# Altium project P2_OBC-ADCS CubeSat - Copy.PrjPcb (part 1 of 2)
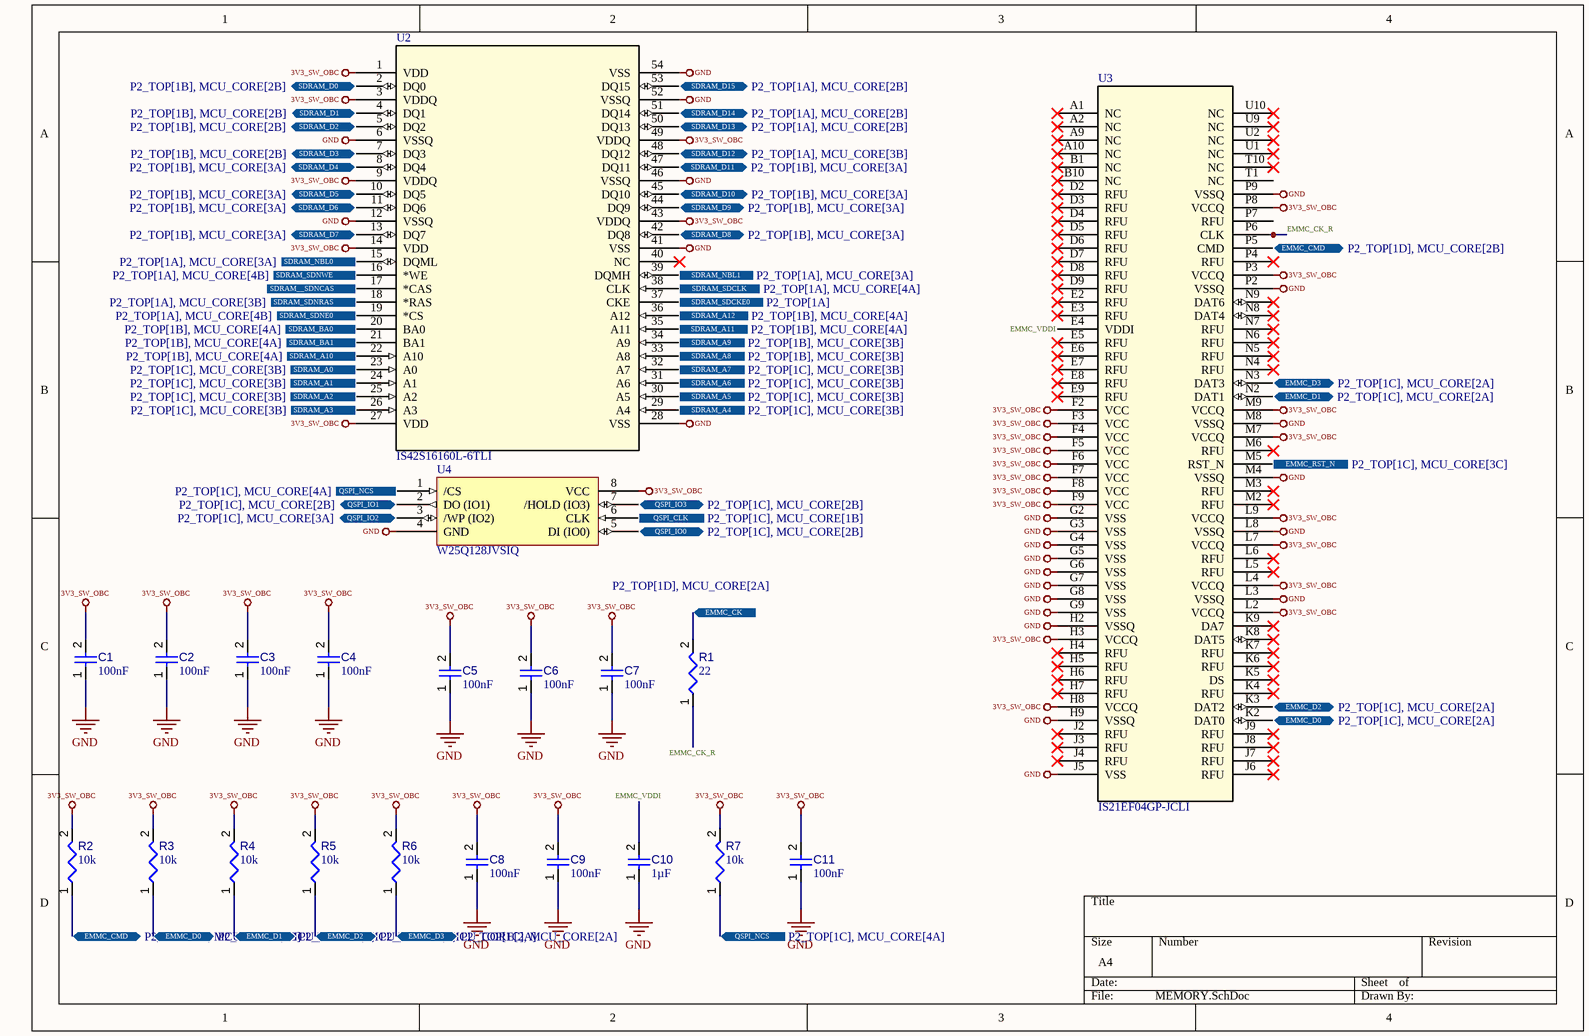
[diagram p0:  MEMORY.SchDoc]
9 sheets, 106 parts. Net scope: hierarchical (ports join the sheet entries above them; power ports are global).
Sheets:
   MEMORY.SchDoc
   P2_TOP.SchDoc
   PWR_IN.SchDoc
   MCU_CORE.SchDoc
   CAM_IF.SchDoc
   ADCS_SENS.SchDoc
   BUS_IF.SchDoc
   MTQ_CH.SchDoc
   PANEL_CH.SchDoc

## Sheet  MEMORY.SchDoc
size A4; SheetNumber: 2; SheetTotal: 9

### Parts
C1  value 100nF  [CAPC0402(1005)60_L]  (hidden comment: Capacitor 100nF +/-20% 25V 0402)
C2  value 100nF  [CAPC0402(1005)60_L]  (hidden comment: Capacitor 100nF +/-20% 25V 0402)
C3  value 100nF  [CAPC0402(1005)60_L]  (hidden comment: Capacitor 100nF +/-20% 25V 0402)
C4  value 100nF  [CAPC0402(1005)60_L]  (hidden comment: Capacitor 100nF +/-20% 25V 0402)
C5  value 100nF  [CAPC0402(1005)60_L]  (hidden comment: Capacitor 100nF +/-20% 25V 0402)
C6  value 100nF  [CAPC0402(1005)60_L]  (hidden comment: Capacitor 100nF +/-20% 25V 0402)
C7  value 100nF  [CAPC0402(1005)60_L]  (hidden comment: Capacitor 100nF +/-20% 25V 0402)
C8  value 100nF  [CAPC0402(1005)60_L]  (hidden comment: Capacitor 100nF +/-20% 25V 0402)
C9  value 100nF  [CAPC0402(1005)60_L]  (hidden comment: Capacitor 100nF +/-20% 25V 0402)
C10  value 1µF  [CAPC0603(1608)100_L]  (hidden comment: Capacitor 1µF +/-40% 50V 0603)
C11  value 100nF  [CAPC0402(1005)60_L]  (hidden comment: Capacitor 100nF +/-20% 25V 0402)
R1  value 22  [RESC0402(1005)_L]  (hidden comment: Resistor 22R  +/-5 % 0402 63 mW)
R2  value 10k  [RESC1005X40X25ML05T05]  (hidden comment: Resistor 10k +/-1% 0402 100 mW)
R3  value 10k  [RESC1005X40X25ML05T05]  (hidden comment: Resistor 10k +/-1% 0402 100 mW)
R4  value 10k  [RESC1005X40X25ML05T05]  (hidden comment: Resistor 10k +/-1% 0402 100 mW)
R5  value 10k  [RESC1005X40X25ML05T05]  (hidden comment: Resistor 10k +/-1% 0402 100 mW)
R6  value 10k  [RESC1005X40X25ML05T05]  (hidden comment: Resistor 10k +/-1% 0402 100 mW)
R7  value 10k  [RESC1005X40X25ML05T05]  (hidden comment: Resistor 10k +/-1% 0402 100 mW)
U2  IS42S16160L-6TLI  [IS42S16160L-6TLI-Footprint-1]
U3  IS21EF04GP-JCLI  [IS21EF04GP-JCLI-Footprint-1]
U4  W25Q128JVSIQ  [W25Q128JVSIQ-Footprint-1]

### Ports
EMMC_CK (in, see P2_TOP[1D], MCU_CORE[2A]), EMMC_CMD (bidir, see P2_TOP[1D], MCU_CORE[2B]), EMMC_D0 (bidir, see P2_TOP[1C], MCU_CORE[2A]), EMMC_D1 (bidir, see P2_TOP[1C], MCU_CORE[2A]), EMMC_D2 (bidir, see P2_TOP[1C], MCU_CORE[2A]), EMMC_D3 (bidir, see P2_TOP[1C], MCU_CORE[2A]), EMMC_RST_N (in, see P2_TOP[1C], MCU_CORE[3C]), QSPI_CLK (in, see P2_TOP[1C], MCU_CORE[1B]), QSPI_IO0 (bidir, see P2_TOP[1C], MCU_CORE[2B]), QSPI_IO1 (bidir, see P2_TOP[1C], MCU_CORE[2B]), QSPI_IO2 (bidir, see P2_TOP[1C], MCU_CORE[3A]), QSPI_IO3 (bidir, see P2_TOP[1C], MCU_CORE[2B]), QSPI_NCS (in, see P2_TOP[1C], MCU_CORE[4A]), SDRAM__SDNCAS (in), SDRAM_A0 (in, see P2_TOP[1C], MCU_CORE[3B]), SDRAM_A1 (in, see P2_TOP[1C], MCU_CORE[3B]), SDRAM_A2 (in, see P2_TOP[1C], MCU_CORE[3B]), SDRAM_A3 (in, see P2_TOP[1C], MCU_CORE[3B]), SDRAM_A4 (in, see P2_TOP[1C], MCU_CORE[3B]), SDRAM_A5 (in, see P2_TOP[1C], MCU_CORE[3B]), SDRAM_A6 (in, see P2_TOP[1C], MCU_CORE[3B]), SDRAM_A7 (in, see P2_TOP[1C], MCU_CORE[3B]), SDRAM_A8 (in, see P2_TOP[1B], MCU_CORE[3B]), SDRAM_A9 (in, see P2_TOP[1B], MCU_CORE[3B]), SDRAM_A10 (in, see P2_TOP[1B], MCU_CORE[4A]), SDRAM_A11 (in, see P2_TOP[1B], MCU_CORE[4A]), SDRAM_A12 (in, see P2_TOP[1B], MCU_CORE[4A]), SDRAM_BA0 (in, see P2_TOP[1B], MCU_CORE[4A]), SDRAM_BA1 (in, see P2_TOP[1B], MCU_CORE[4A]), SDRAM_D0 (bidir, see P2_TOP[1B], MCU_CORE[2B]), SDRAM_D1 (bidir, see P2_TOP[1B], MCU_CORE[2B]), SDRAM_D2 (bidir, see P2_TOP[1B], MCU_CORE[2B]), SDRAM_D3 (bidir, see P2_TOP[1B], MCU_CORE[2B]), SDRAM_D4 (bidir, see P2_TOP[1B], MCU_CORE[3A]), SDRAM_D5 (bidir, see P2_TOP[1B], MCU_CORE[3A]), SDRAM_D6 (bidir, see P2_TOP[1B], MCU_CORE[3A]), SDRAM_D7 (bidir, see P2_TOP[1B], MCU_CORE[3A]), SDRAM_D8 (bidir, see P2_TOP[1B], MCU_CORE[3A]), SDRAM_D9 (bidir, see P2_TOP[1B], MCU_CORE[3A]), SDRAM_D10 (bidir, see P2_TOP[1B], MCU_CORE[3A]), SDRAM_D11 (bidir, see P2_TOP[1B], MCU_CORE[3A]), SDRAM_D12 (bidir, see P2_TOP[1A], MCU_CORE[3B]), SDRAM_D13 (bidir, see P2_TOP[1A], MCU_CORE[2B]), SDRAM_D14 (bidir, see P2_TOP[1A], MCU_CORE[2B]), SDRAM_D15 (bidir, see P2_TOP[1A], MCU_CORE[2B]), SDRAM_NBL0 (in, see P2_TOP[1A], MCU_CORE[3A]), SDRAM_NBL1 (in, see P2_TOP[1A], MCU_CORE[3A]), SDRAM_SDCKE0 (in, see P2_TOP[1A]), SDRAM_SDCLK (in, see P2_TOP[1A], MCU_CORE[4A]), SDRAM_SDNE0 (in, see P2_TOP[1A], MCU_CORE[4B]), SDRAM_SDNRAS (in, see P2_TOP[1A], MCU_CORE[3B]), SDRAM_SDNWE (in, see P2_TOP[1A], MCU_CORE[4B])

### Nets
3V3_SW_OBC: C1.2 C2.2 C3.2 C4.2 C5.2 C6.2 C7.2 C8.2 C9.2 C11.2 R2.2 R3.2 R4.2 R5.2 R6.2 R7.2 U2.1(VDD) U2.3(VDDQ) U2.9(VDDQ) U2.14(VDD) U2.27(VDD) U2.43(VDDQ) U2.49(VDDQ) U3.F2(VCC) U3.F3(VCC) U3.F4(VCC) U3.F5(VCC) U3.F6(VCC) U3.F7(VCC) U3.F8(VCC) U3.F9(VCC) U3.H3(VCCQ) U3.H8(VCCQ) U3.L2(VCCQ) U3.L4(VCCQ) U3.L7(VCCQ) U3.L9(VCCQ) U3.M7(VCCQ) U3.M9(VCCQ) U3.P3(VCCQ) U3.P8(VCCQ) U4.8(VCC)
GND: C1.1 C2.1 C3.1 C4.1 C5.1 C6.1 C7.1 C8.1 C9.1 C10.1 C11.1 U2.6(VSSQ) U2.12(VSSQ) U2.28(VSS) U2.41(VSS) U2.46(VSSQ) U2.52(VSSQ) U2.54(VSS) U3.G2(VSS) U3.G3(VSS) U3.G4(VSS) U3.G5(VSS) U3.G6(VSS) U3.G7(VSS) U3.G8(VSS) U3.G9(VSS) U3.H2(VSSQ) U3.H9(VSSQ) U3.J5(VSS) U3.L3(VSSQ) U3.L8(VSSQ) U3.M4(VSSQ) U3.M8(VSSQ) U3.P2(VSSQ) U3.P9(VSSQ) U4.4(GND)
EMMC_CK_R: R1.1 U3.P6(CLK)
EMMC_VDDI: C10.2 U3.E4(VDDI)
NetR1_2: R1.2 ; port EMMC_CK
NetR2_1: R2.1 U3.P5(CMD) ; port EMMC_CMD
NetR3_1: R3.1 U3.K2(DAT0) ; port EMMC_D0
NetR4_1: R4.1 U3.N2(DAT1) ; port EMMC_D1
NetR5_1: R5.1 U3.K3(DAT2) ; port EMMC_D2
NetR6_1: R6.1 U3.N3(DAT3) ; port EMMC_D3
NetR7_1: R7.1 U4.1(/CS) ; port QSPI_NCS
NetU2_2: U2.2(DQ0) ; port SDRAM_D0
NetU2_4: U2.4(DQ1) ; port SDRAM_D1
NetU2_5: U2.5(DQ2) ; port SDRAM_D2
NetU2_7: U2.7(DQ3) ; port SDRAM_D3
NetU2_8: U2.8(DQ4) ; port SDRAM_D4
NetU2_10: U2.10(DQ5) ; port SDRAM_D5
NetU2_11: U2.11(DQ6) ; port SDRAM_D6
NetU2_13: U2.13(DQ7) ; port SDRAM_D7
NetU2_15: U2.15(DQML) ; port SDRAM_NBL0
NetU2_16: U2.16(*WE) ; port SDRAM_SDNWE
NetU2_17: U2.17(*CAS) ; port SDRAM__SDNCAS
NetU2_18: U2.18(*RAS) ; port SDRAM_SDNRAS
NetU2_19: U2.19(*CS) ; port SDRAM_SDNE0
NetU2_20: U2.20(BA0) ; port SDRAM_BA0
NetU2_21: U2.21(BA1) ; port SDRAM_BA1
NetU2_22: U2.22(A10) ; port SDRAM_A10
NetU2_23: U2.23(A0) ; port SDRAM_A0
NetU2_24: U2.24(A1) ; port SDRAM_A1
NetU2_25: U2.25(A2) ; port SDRAM_A2
NetU2_26: U2.26(A3) ; port SDRAM_A3
NetU2_29: U2.29(A4) ; port SDRAM_A4
NetU2_30: U2.30(A5) ; port SDRAM_A5
NetU2_31: U2.31(A6) ; port SDRAM_A6
NetU2_32: U2.32(A7) ; port SDRAM_A7
NetU2_33: U2.33(A8) ; port SDRAM_A8
NetU2_34: U2.34(A9) ; port SDRAM_A9
NetU2_35: U2.35(A11) ; port SDRAM_A11
NetU2_36: U2.36(A12) ; port SDRAM_A12
NetU2_37: U2.37(CKE) ; port SDRAM_SDCKE0
NetU2_38: U2.38(CLK) ; port SDRAM_SDCLK
NetU2_39: U2.39(DQMH) ; port SDRAM_NBL1
NetU2_42: U2.42(DQ8) ; port SDRAM_D8
NetU2_44: U2.44(DQ9) ; port SDRAM_D9
NetU2_45: U2.45(DQ10) ; port SDRAM_D10
NetU2_47: U2.47(DQ11) ; port SDRAM_D11
NetU2_48: U2.48(DQ12) ; port SDRAM_D12
NetU2_50: U2.50(DQ13) ; port SDRAM_D13
NetU2_51: U2.51(DQ14) ; port SDRAM_D14
NetU2_53: U2.53(DQ15) ; port SDRAM_D15
NetU3_M5: U3.M5(RST_N) ; port EMMC_RST_N
NetU4_2: U4.2(DO_(IO1)) ; port QSPI_IO1
NetU4_3: U4.3(/WP_(IO2)) ; port QSPI_IO2
NetU4_5: U4.5(DI_(IO0)) ; port QSPI_IO0
NetU4_6: U4.6(CLK) ; port QSPI_CLK
NetU4_7: U4.7(/HOLD_(IO3)) ; port QSPI_IO3

Not connected (* = marked no-connect by the designer): U2 40(NC)*; U3 A1(NC)* A2(NC)* A9(NC)* A10(NC)* B1(NC)* B10(NC)* D2(RFU)* D3(RFU)* D4(RFU)* D5(RFU)* D6(RFU)* D7(RFU)* D8(RFU)* D9(RFU)* E2(RFU)* E3(RFU)* E5(RFU)* E6(RFU)* E7(RFU)* E8(RFU)* E9(RFU)* H4(RFU)* H5(RFU)* H6(RFU)* H7(RFU)* J2(RFU)* J3(RFU)* J4(RFU)* J6(RFU)* J7(RFU)* J8(RFU)* J9(RFU)* K4(RFU)* K5(DS)* K6(RFU)* K7(RFU)* K8(DAT5)* K9(DA7)* L5(RFU)* L6(RFU)* M2(RFU)* M3(RFU)* M6(RFU)* N4(RFU)* N5(RFU)* N6(RFU)* N7(RFU)* N8(DAT4)* N9(DAT6)* P4(RFU)* P7(RFU) T1(NC) T10(NC)* U1(NC)* U2(NC)* U9(NC)* U10(NC)*

### Library data of the parts
C1-C9 C11 = CMP-001-00065-4: Chip Capacitor, 100nF +/-20%, 25V, 0402, Thickness 0.6 mm; Tolerance: 10%; Max Operating Temperature: 85°C; Min Operating Temperature: -55°C; Pins: 2; Voltage Rating: 25V; Mounting Technology: SMT; Case/Package: 0402
C10 = CMP-001-00078-4: Chip Capacitor, 1µF +/-40%, 50V, 0603, Thickness 1 mm; Tolerance: 10%; Case/Package: 0603; Pins: 2; Max Operating Temperature: 85°C; Voltage Rating: 50V; Mounting Technology: SMT; Min Operating Temperature: -55°C
R1 = CMP-009-00164-3: Chip Resistor, 22 Ohms, +/-5 %, 63 mW, -55 to 155 degC, 0402; Tolerance: 5%; Power: 63mW; Pins: 2; Min Operating Temperature: -55°C; Max Operating Temperature: 155°C; Case/Package: 0402
R2-R7 = CMP-009-00015-5: Chip Resistor, 10 KOhm, +/- 1%, 0.1 W, -55 to 155 degC, 0402 (1005 Metric); Voltage Rating: 50V; Power: 100mW; Case/Package: 0402; RoHS Compliant: True; Min Operating Temperature: -55°C; Mounting Technology: SM; Tolerance: 1%; Max Operating Temperature: 155°C; Pins: 2
U2 = CMP-020-00025-3: 256M, 3.3V, Sdram, 16Mx16, 166Mhz, 54 Pi;; Number of Circuits: 1; Access Time: 5.4ns; Min Supply Voltage: 3V; Max Supply Current: 160mA; Max Supply Voltage: 3.6V; Terminal Pitch: 800µm; REACH SVHC: Unaffected; Length: 22.22mm; Harmonized Tariff Schedule (HTS) Code: 8542.32.00.24; Introduction Date: 2022-01-25; Min Operating Temperature: -40°C; Lifecycle Status: Production; Max Operating Temperature: 85°C; RoHS: Compliant; Number of Ports: 1; Width: 10.16mm; Export Control Classification Number (ECCN) Code: EAR99; Height - Seated (Max): 1.2mm; Number of Terminals: 54; Nominal Supply Voltage (DC): 3.3V; Country of Origin: Mainland China, Taiwan
U3 = CMP-019-00054-3: Flash Memory, pSLC NAND, 4 Gbyte, 32G x 1bit, 8G x 4bit, 4G x 8bit, eMMC 5.1, 153 Pins, FBGA; Number of Circuits: 1; Max Supply Voltage: 3.6V; Min Supply Voltage: 2.7V; Max Supply Current: 45mA; Nominal Supply Voltage (DC): 3.3V; Lifecycle Status: Production; Length: 13mm; REACH SVHC: Unaffected; Width: 11.5mm; Height - Seated (Max): 1mm; Min Operating Temperature: -40°C; RoHS: Compliant; Terminal Pitch: 500µm; Max Operating Temperature: 85°C; Number of Terminals: 153
U4 = CMP-019-00055-2: NOR Flash Serial (SPI, Dual SPI, Quad SPI) 3.3V 128M-bit 16M x 8 6ns 8-Pin SOIC Tube; Min Supply Voltage: 2.7V; Nominal Supply Voltage (DC): 3V; Max Supply Voltage: 3.6V; Frequency: 104MHz; Max Supply Current: 20mA; Number of Circuits: 1; Memory Size: 16MB; Temperature Grade: Industrial; Number of Terminals: 8; Length: 5.23mm; Introduction Date: 2016-11-14; Height - Seated (Max): 2.16mm; China RoHS: Compliant; Min Operating Temperature: -40°C; Lifecycle Status: Production; Max Operating Temperature: 85°C; REACH SVHC: Unaffected; Height: 2.16mm; Country of Origin: Taiwan; Terminal Pitch: 1.27mm; RoHS: Compliant; Interface: SPI; Case/Package: SOP; Width: 5.23mm; Memory Format: FLASH; Export Control Classification Number (ECCN) Code: EAR99; Ambient Temperature Range High: 85°C; Harmonized Tariff Schedule (HTS) Code: 8542.32.00.51; Schedule B: 8542320070, 8542320070

## Sheet  P2_TOP.SchDoc
size A4; SheetNumber: 1; SheetTotal: 9
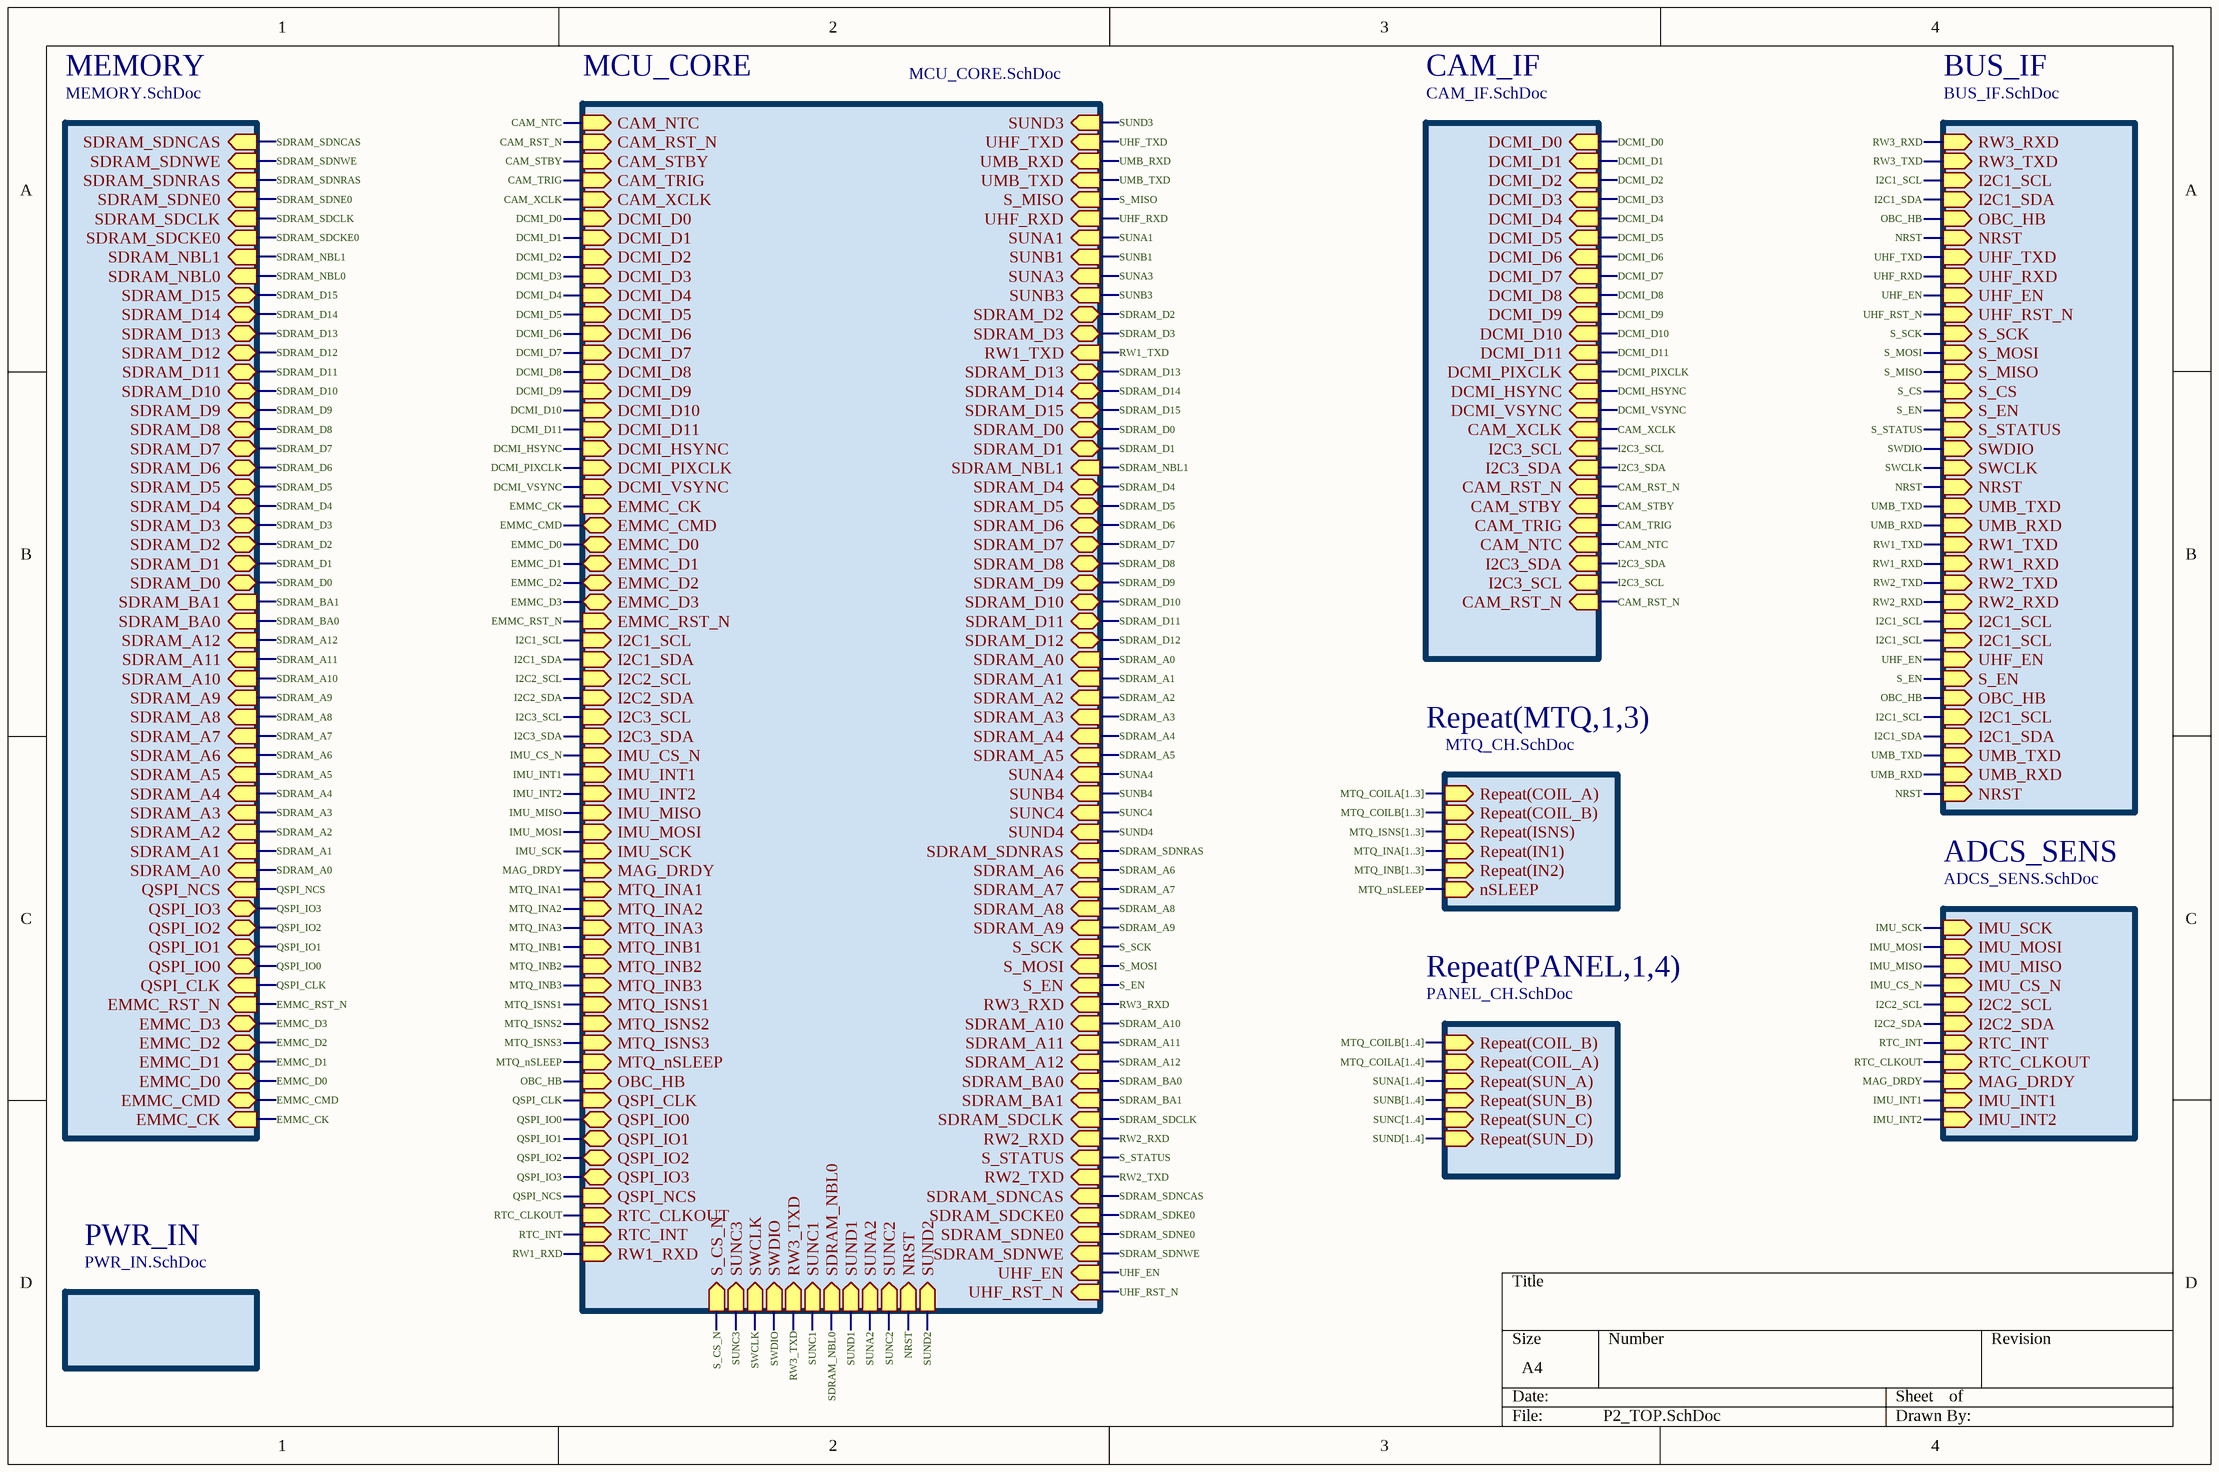
[diagram p1:  P2_TOP.SchDoc]

### Sub-sheets
ADCS_SENS = ADCS_SENS.SchDoc (file not in this document): IMU_SCK (in), IMU_MOSI (in), IMU_MISO (in), IMU_CS_N (in), I2C2_SCL (in), I2C2_SDA (in), RTC_INT (in), RTC_CLKOUT (in), MAG_DRDY (in), IMU_INT1 (in), IMU_INT2 (in)
BUS_IF = BUS_IF.SchDoc (file not in this document): RW3_RXD (in), RW3_TXD (in), I2C1_SCL (in), I2C1_SDA (in), OBC_HB (in), NRST (in), UHF_TXD (in), UHF_RXD (in), UHF_EN (in), UHF_RST_N (in), S_SCK (in), S_MOSI (in), S_MISO (in), S_CS (in), S_EN (in), S_STATUS (in), SWDIO (in), SWCLK (in), NRST (in), UMB_TXD (in), UMB_RXD (in), RW1_TXD (in), RW1_RXD (in), RW2_TXD (in), RW2_RXD (in), I2C1_SCL (in), I2C1_SCL (in), UHF_EN (in), S_EN (in), OBC_HB (in), I2C1_SCL (in), I2C1_SDA (in), UMB_TXD (in), UMB_RXD (in), NRST (in)
CAM_IF = CAM_IF.SchDoc (file not in this document): DCMI_D0 (in), DCMI_D1 (in), DCMI_D2 (in), DCMI_D3 (in), DCMI_D4 (in), DCMI_D5 (in), DCMI_D6 (in), DCMI_D7 (in), DCMI_D8 (in), DCMI_D9 (in), DCMI_D10 (in), DCMI_D11 (in), DCMI_PIXCLK (in), DCMI_HSYNC (in), DCMI_VSYNC (in), CAM_XCLK (in), I2C3_SCL (in), I2C3_SDA (in), CAM_RST_N (in), CAM_STBY (in), CAM_TRIG (in), CAM_NTC (in), I2C3_SDA (in), I2C3_SCL (in), CAM_RST_N (in)
MCU_CORE = MCU_CORE.SchDoc (file not in this document): CAM_NTC (in), CAM_RST_N (in), CAM_STBY (in), CAM_TRIG (in), CAM_XCLK (in), DCMI_D0 (in), DCMI_D1 (in), DCMI_D2 (in), DCMI_D3 (in), DCMI_D4 (in), DCMI_D5 (in), DCMI_D6 (in), DCMI_D7 (in), DCMI_D8 (in), DCMI_D9 (in), DCMI_D10 (in), DCMI_D11 (in), DCMI_HSYNC (in), DCMI_PIXCLK (in), DCMI_VSYNC (in), EMMC_CK (in), EMMC_CMD (bidir), EMMC_D0 (bidir), EMMC_D1 (bidir), EMMC_D2 (bidir), EMMC_D3 (bidir), EMMC_RST_N (in), I2C1_SCL (in), I2C1_SDA (in), I2C2_SCL (in), I2C2_SDA (in), I2C3_SCL (in), I2C3_SDA (in), IMU_CS_N (in), IMU_INT1 (in), IMU_INT2 (in), IMU_MISO (in), IMU_MOSI (in), IMU_SCK (in), MAG_DRDY (in), MTQ_INA1 (in), MTQ_INA2 (in), MTQ_INA3 (in), MTQ_INB1 (in), MTQ_INB2 (in), MTQ_INB3 (in), MTQ_ISNS1 (in), MTQ_ISNS2 (in), MTQ_ISNS3 (in), MTQ_nSLEEP (in), SUND3 (in), UHF_TXD (in), UMB_RXD (in), UMB_TXD (in), S_MISO (in), UHF_RXD (in), SUNA1 (in), SUNB1 (in), SUNA3 (in), SUNB3 (in), SDRAM_D2 (bidir), SDRAM_D3 (bidir), RW1_TXD (in), SDRAM_D13 (bidir), SDRAM_D14 (bidir), SDRAM_D15 (bidir), SDRAM_D0 (bidir), SDRAM_D1 (bidir), SDRAM_NBL1 (in), SDRAM_D4 (bidir), SDRAM_D5 (bidir), SDRAM_D6 (bidir), SDRAM_D7 (bidir), SDRAM_D8 (bidir), SDRAM_D9 (bidir), SDRAM_D10 (bidir), SDRAM_D11 (bidir), SDRAM_D12 (bidir), SDRAM_A0 (in), SDRAM_A1 (in), SDRAM_A2 (in), SDRAM_A3 (in), SDRAM_A4 (in), SDRAM_A5 (in), SUNA4 (in), SUNB4 (in), SUNC4 (in), SUND4 (in), SDRAM_SDNRAS (in), SDRAM_A6 (in), SDRAM_A7 (in), SDRAM_A8 (in), SDRAM_A9 (in), S_SCK (in), S_MOSI (in), S_EN (in), RW3_RXD (in), SDRAM_A10 (in), SDRAM_A11 (in), SDRAM_A12 (in), SDRAM_BA0 (in), SDRAM_BA1 (in), SDRAM_SDCLK (in), RW2_RXD (in), S_STATUS (in), RW2_TXD (in), SDRAM_SDNCAS (in), SDRAM_SDCKE0 (in), SDRAM_SDNE0 (in), SDRAM_SDNWE (in), UHF_EN (in), UHF_RST_N (in), OBC_HB (in), QSPI_CLK (in), QSPI_IO0 (bidir), QSPI_IO1 (bidir), QSPI_IO2 (bidir), QSPI_IO3 (bidir), QSPI_NCS (in), RTC_CLKOUT (in), RTC_INT (in), RW1_RXD (in), SUNC1 (in), SDRAM_NBL0 (in), SUND1 (in), SUNA2 (in), SUNC2 (in), NRST (in), SUND2 (in), RW3_TXD (in), SWDIO (in), SWCLK (in), SUNC3 (in), S_CS_N (in)
MEMORY = MEMORY.SchDoc (file not in this document): SDRAM_SDNWE (in), SDRAM_SDNRAS (in), SDRAM_SDNE0 (in), SDRAM_SDCLK (in), SDRAM_SDCKE0 (in), SDRAM_NBL1 (in), SDRAM_NBL0 (in), SDRAM_D15 (bidir), SDRAM_D14 (bidir), SDRAM_D13 (bidir), SDRAM_D12 (bidir), SDRAM_D11 (bidir), SDRAM_D10 (bidir), SDRAM_D9 (bidir), SDRAM_D8 (bidir), SDRAM_D7 (bidir), SDRAM_D6 (bidir), SDRAM_D5 (bidir), SDRAM_D4 (bidir), SDRAM_D3 (bidir), SDRAM_D2 (bidir), SDRAM_D1 (bidir), SDRAM_D0 (bidir), SDRAM_BA1 (in), SDRAM_BA0 (in), SDRAM_A12 (in), SDRAM_A11 (in), SDRAM_A10 (in), SDRAM_A9 (in), SDRAM_A8 (in), SDRAM_A7 (in), SDRAM_A6 (in), SDRAM_A5 (in), SDRAM_A4 (in), SDRAM_A3 (in), SDRAM_A2 (in), SDRAM_A1 (in), SDRAM_A0 (in), QSPI_NCS (in), QSPI_IO3 (bidir), QSPI_IO2 (bidir), QSPI_IO1 (bidir), QSPI_IO0 (bidir), QSPI_CLK (in), EMMC_RST_N (in), EMMC_D3 (bidir), EMMC_D2 (bidir), EMMC_D1 (bidir), EMMC_D0 (bidir), EMMC_CK (in), EMMC_CMD (bidir), SDRAM_SDNCAS (in)
PWR_IN = PWR_IN.SchDoc (file not in this document): no entries
Repeat(MTQ,1,3) = MTQ_CH.SchDoc (file not in this document): Repeat(COIL_A) (in), Repeat(COIL_B) (in), Repeat(ISNS) (in), Repeat(IN1) (in), Repeat(IN2) (in), nSLEEP (in)
Repeat(PANEL,1,4) = PANEL_CH.SchDoc (file not in this document): Repeat(COIL_B) (in), Repeat(COIL_A) (in), Repeat(SUN_A) (in), Repeat(SUN_B) (in), Repeat(SUN_C) (in), Repeat(SUN_D) (in)

### Nets
CAM_NTC: sheet CAM_IF/CAM_NTC, sheet MCU_CORE/CAM_NTC
CAM_RST_N: sheet CAM_IF/CAM_RST_N, sheet CAM_IF/CAM_RST_N, sheet MCU_CORE/CAM_RST_N
CAM_STBY: sheet CAM_IF/CAM_STBY, sheet MCU_CORE/CAM_STBY
CAM_TRIG: sheet CAM_IF/CAM_TRIG, sheet MCU_CORE/CAM_TRIG
CAM_XCLK: sheet CAM_IF/CAM_XCLK, sheet MCU_CORE/CAM_XCLK
DCMI_D0: sheet CAM_IF/DCMI_D0, sheet MCU_CORE/DCMI_D0
DCMI_D1: sheet CAM_IF/DCMI_D1, sheet MCU_CORE/DCMI_D1
DCMI_D2: sheet CAM_IF/DCMI_D2, sheet MCU_CORE/DCMI_D2
DCMI_D3: sheet CAM_IF/DCMI_D3, sheet MCU_CORE/DCMI_D3
DCMI_D4: sheet CAM_IF/DCMI_D4, sheet MCU_CORE/DCMI_D4
DCMI_D5: sheet CAM_IF/DCMI_D5, sheet MCU_CORE/DCMI_D5
DCMI_D6: sheet CAM_IF/DCMI_D6, sheet MCU_CORE/DCMI_D6
DCMI_D7: sheet CAM_IF/DCMI_D7, sheet MCU_CORE/DCMI_D7
DCMI_D8: sheet CAM_IF/DCMI_D8, sheet MCU_CORE/DCMI_D8
DCMI_D9: sheet CAM_IF/DCMI_D9, sheet MCU_CORE/DCMI_D9
DCMI_D10: sheet CAM_IF/DCMI_D10, sheet MCU_CORE/DCMI_D10
DCMI_D11: sheet CAM_IF/DCMI_D11, sheet MCU_CORE/DCMI_D11
DCMI_HSYNC: sheet CAM_IF/DCMI_HSYNC, sheet MCU_CORE/DCMI_HSYNC
DCMI_PIXCLK: sheet CAM_IF/DCMI_PIXCLK, sheet MCU_CORE/DCMI_PIXCLK
DCMI_VSYNC: sheet CAM_IF/DCMI_VSYNC, sheet MCU_CORE/DCMI_VSYNC
EMMC_CK: sheet MEMORY/EMMC_CK, sheet MCU_CORE/EMMC_CK
EMMC_CMD: sheet MEMORY/EMMC_CMD, sheet MCU_CORE/EMMC_CMD
EMMC_D0: sheet MEMORY/EMMC_D0, sheet MCU_CORE/EMMC_D0
EMMC_D1: sheet MEMORY/EMMC_D1, sheet MCU_CORE/EMMC_D1
EMMC_D2: sheet MEMORY/EMMC_D2, sheet MCU_CORE/EMMC_D2
EMMC_D3: sheet MEMORY/EMMC_D3, sheet MCU_CORE/EMMC_D3
EMMC_RST_N: sheet MEMORY/EMMC_RST_N, sheet MCU_CORE/EMMC_RST_N
I2C1_SCL: sheet MCU_CORE/I2C1_SCL, sheet BUS_IF/I2C1_SCL, sheet BUS_IF/I2C1_SCL, sheet BUS_IF/I2C1_SCL, sheet BUS_IF/I2C1_SCL
I2C1_SDA: sheet MCU_CORE/I2C1_SDA, sheet BUS_IF/I2C1_SDA, sheet BUS_IF/I2C1_SDA
I2C2_SCL: sheet MCU_CORE/I2C2_SCL, sheet ADCS_SENS/I2C2_SCL
I2C2_SDA: sheet MCU_CORE/I2C2_SDA, sheet ADCS_SENS/I2C2_SDA
I2C3_SCL: sheet CAM_IF/I2C3_SCL, sheet CAM_IF/I2C3_SCL, sheet MCU_CORE/I2C3_SCL
I2C3_SDA: sheet CAM_IF/I2C3_SDA, sheet CAM_IF/I2C3_SDA, sheet MCU_CORE/I2C3_SDA
IMU_CS_N: sheet MCU_CORE/IMU_CS_N, sheet ADCS_SENS/IMU_CS_N
IMU_INT1: sheet MCU_CORE/IMU_INT1, sheet ADCS_SENS/IMU_INT1
IMU_INT2: sheet MCU_CORE/IMU_INT2, sheet ADCS_SENS/IMU_INT2
IMU_MISO: sheet MCU_CORE/IMU_MISO, sheet ADCS_SENS/IMU_MISO
IMU_MOSI: sheet MCU_CORE/IMU_MOSI, sheet ADCS_SENS/IMU_MOSI
IMU_SCK: sheet MCU_CORE/IMU_SCK, sheet ADCS_SENS/IMU_SCK
MAG_DRDY: sheet MCU_CORE/MAG_DRDY, sheet ADCS_SENS/MAG_DRDY
MTQ_INA1: sheet MCU_CORE/MTQ_INA1
MTQ_INA2: sheet MCU_CORE/MTQ_INA2
MTQ_INA3: sheet MCU_CORE/MTQ_INA3
MTQ_INB1: sheet MCU_CORE/MTQ_INB1
MTQ_INB2: sheet MCU_CORE/MTQ_INB2
MTQ_INB3: sheet MCU_CORE/MTQ_INB3
MTQ_ISNS1: sheet MCU_CORE/MTQ_ISNS1
MTQ_ISNS2: sheet MCU_CORE/MTQ_ISNS2
MTQ_ISNS3: sheet MCU_CORE/MTQ_ISNS3
MTQ_nSLEEP: sheet MCU_CORE/MTQ_nSLEEP, sheet Repeat(MTQ,1,3)/nSLEEP
NRST: sheet MCU_CORE/NRST, sheet BUS_IF/NRST, sheet BUS_IF/NRST, sheet BUS_IF/NRST
OBC_HB: sheet MCU_CORE/OBC_HB, sheet BUS_IF/OBC_HB, sheet BUS_IF/OBC_HB
QSPI_CLK: sheet MEMORY/QSPI_CLK, sheet MCU_CORE/QSPI_CLK
QSPI_IO0: sheet MEMORY/QSPI_IO0, sheet MCU_CORE/QSPI_IO0
QSPI_IO1: sheet MEMORY/QSPI_IO1, sheet MCU_CORE/QSPI_IO1
QSPI_IO2: sheet MEMORY/QSPI_IO2, sheet MCU_CORE/QSPI_IO2
QSPI_IO3: sheet MEMORY/QSPI_IO3, sheet MCU_CORE/QSPI_IO3
QSPI_NCS: sheet MEMORY/QSPI_NCS, sheet MCU_CORE/QSPI_NCS
RTC_CLKOUT: sheet MCU_CORE/RTC_CLKOUT, sheet ADCS_SENS/RTC_CLKOUT
RTC_INT: sheet MCU_CORE/RTC_INT, sheet ADCS_SENS/RTC_INT
RW1_RXD: sheet MCU_CORE/RW1_RXD, sheet BUS_IF/RW1_RXD
RW1_TXD: sheet MCU_CORE/RW1_TXD, sheet BUS_IF/RW1_TXD
RW2_RXD: sheet MCU_CORE/RW2_RXD, sheet BUS_IF/RW2_RXD
RW2_TXD: sheet MCU_CORE/RW2_TXD, sheet BUS_IF/RW2_TXD
RW3_RXD: sheet MCU_CORE/RW3_RXD, sheet BUS_IF/RW3_RXD
RW3_TXD: sheet MCU_CORE/RW3_TXD, sheet BUS_IF/RW3_TXD
S_CS: sheet BUS_IF/S_CS
S_CS_N: sheet MCU_CORE/S_CS_N
S_EN: sheet MCU_CORE/S_EN, sheet BUS_IF/S_EN, sheet BUS_IF/S_EN
S_MISO: sheet MCU_CORE/S_MISO, sheet BUS_IF/S_MISO
S_MOSI: sheet MCU_CORE/S_MOSI, sheet BUS_IF/S_MOSI
S_SCK: sheet MCU_CORE/S_SCK, sheet BUS_IF/S_SCK
S_STATUS: sheet MCU_CORE/S_STATUS, sheet BUS_IF/S_STATUS
SDRAM_A0: sheet MEMORY/SDRAM_A0, sheet MCU_CORE/SDRAM_A0
SDRAM_A1: sheet MEMORY/SDRAM_A1, sheet MCU_CORE/SDRAM_A1
SDRAM_A2: sheet MEMORY/SDRAM_A2, sheet MCU_CORE/SDRAM_A2
SDRAM_A3: sheet MEMORY/SDRAM_A3, sheet MCU_CORE/SDRAM_A3
SDRAM_A4: sheet MEMORY/SDRAM_A4, sheet MCU_CORE/SDRAM_A4
SDRAM_A5: sheet MEMORY/SDRAM_A5, sheet MCU_CORE/SDRAM_A5
SDRAM_A6: sheet MEMORY/SDRAM_A6, sheet MCU_CORE/SDRAM_A6
SDRAM_A7: sheet MEMORY/SDRAM_A7, sheet MCU_CORE/SDRAM_A7
SDRAM_A8: sheet MEMORY/SDRAM_A8, sheet MCU_CORE/SDRAM_A8
SDRAM_A9: sheet MEMORY/SDRAM_A9, sheet MCU_CORE/SDRAM_A9
SDRAM_A10: sheet MEMORY/SDRAM_A10, sheet MCU_CORE/SDRAM_A10
SDRAM_A11: sheet MEMORY/SDRAM_A11, sheet MCU_CORE/SDRAM_A11
SDRAM_A12: sheet MEMORY/SDRAM_A12, sheet MCU_CORE/SDRAM_A12
SDRAM_BA0: sheet MEMORY/SDRAM_BA0, sheet MCU_CORE/SDRAM_BA0
SDRAM_BA1: sheet MEMORY/SDRAM_BA1, sheet MCU_CORE/SDRAM_BA1
SDRAM_D0: sheet MEMORY/SDRAM_D0, sheet MCU_CORE/SDRAM_D0
SDRAM_D1: sheet MEMORY/SDRAM_D1, sheet MCU_CORE/SDRAM_D1
SDRAM_D2: sheet MEMORY/SDRAM_D2, sheet MCU_CORE/SDRAM_D2
SDRAM_D3: sheet MEMORY/SDRAM_D3, sheet MCU_CORE/SDRAM_D3
SDRAM_D4: sheet MEMORY/SDRAM_D4, sheet MCU_CORE/SDRAM_D4
SDRAM_D5: sheet MEMORY/SDRAM_D5, sheet MCU_CORE/SDRAM_D5
SDRAM_D6: sheet MEMORY/SDRAM_D6, sheet MCU_CORE/SDRAM_D6
SDRAM_D7: sheet MEMORY/SDRAM_D7, sheet MCU_CORE/SDRAM_D7
SDRAM_D8: sheet MEMORY/SDRAM_D8, sheet MCU_CORE/SDRAM_D8
SDRAM_D9: sheet MEMORY/SDRAM_D9, sheet MCU_CORE/SDRAM_D9
SDRAM_D10: sheet MEMORY/SDRAM_D10, sheet MCU_CORE/SDRAM_D10
SDRAM_D11: sheet MEMORY/SDRAM_D11, sheet MCU_CORE/SDRAM_D11
SDRAM_D12: sheet MEMORY/SDRAM_D12, sheet MCU_CORE/SDRAM_D12
SDRAM_D13: sheet MEMORY/SDRAM_D13, sheet MCU_CORE/SDRAM_D13
SDRAM_D14: sheet MEMORY/SDRAM_D14, sheet MCU_CORE/SDRAM_D14
SDRAM_D15: sheet MEMORY/SDRAM_D15, sheet MCU_CORE/SDRAM_D15
SDRAM_NBL0: sheet MEMORY/SDRAM_NBL0, sheet MCU_CORE/SDRAM_NBL0
SDRAM_NBL1: sheet MEMORY/SDRAM_NBL1, sheet MCU_CORE/SDRAM_NBL1
SDRAM_SDCKE0: sheet MEMORY/SDRAM_SDCKE0
SDRAM_SDCLK: sheet MEMORY/SDRAM_SDCLK, sheet MCU_CORE/SDRAM_SDCLK
SDRAM_SDKE0: sheet MCU_CORE/SDRAM_SDCKE0
SDRAM_SDNCAS: sheet MEMORY/SDRAM_SDNCAS, sheet MCU_CORE/SDRAM_SDNCAS
SDRAM_SDNE0: sheet MEMORY/SDRAM_SDNE0, sheet MCU_CORE/SDRAM_SDNE0
SDRAM_SDNRAS: sheet MEMORY/SDRAM_SDNRAS, sheet MCU_CORE/SDRAM_SDNRAS
SDRAM_SDNWE: sheet MEMORY/SDRAM_SDNWE, sheet MCU_CORE/SDRAM_SDNWE
SUNA1: sheet MCU_CORE/SUNA1
SUNA2: sheet MCU_CORE/SUNA2
SUNA3: sheet MCU_CORE/SUNA3
SUNA4: sheet MCU_CORE/SUNA4
SUNB1: sheet MCU_CORE/SUNB1
SUNB3: sheet MCU_CORE/SUNB3
SUNB4: sheet MCU_CORE/SUNB4
SUNC1: sheet MCU_CORE/SUNC1
SUNC2: sheet MCU_CORE/SUNC2
SUNC3: sheet MCU_CORE/SUNC3
SUNC4: sheet MCU_CORE/SUNC4
SUND1: sheet MCU_CORE/SUND1
SUND2: sheet MCU_CORE/SUND2
SUND3: sheet MCU_CORE/SUND3
SUND4: sheet MCU_CORE/SUND4
SWCLK: sheet MCU_CORE/SWCLK, sheet BUS_IF/SWCLK
SWDIO: sheet MCU_CORE/SWDIO, sheet BUS_IF/SWDIO
UHF_EN: sheet MCU_CORE/UHF_EN, sheet BUS_IF/UHF_EN, sheet BUS_IF/UHF_EN
UHF_RST_N: sheet MCU_CORE/UHF_RST_N, sheet BUS_IF/UHF_RST_N
UHF_RXD: sheet MCU_CORE/UHF_RXD, sheet BUS_IF/UHF_RXD
UHF_TXD: sheet MCU_CORE/UHF_TXD, sheet BUS_IF/UHF_TXD
UMB_RXD: sheet MCU_CORE/UMB_RXD, sheet BUS_IF/UMB_RXD, sheet BUS_IF/UMB_RXD
UMB_TXD: sheet MCU_CORE/UMB_TXD, sheet BUS_IF/UMB_TXD, sheet BUS_IF/UMB_TXD

### Buses and harness runs
bus MTQ_COILA[1..3] = sheet Repeat(MTQ,1,3)/Repeat(COIL_A)
bus MTQ_COILA[1..4] = sheet Repeat(PANEL,1,4)/Repeat(COIL_A)
bus MTQ_COILB[1..3] = sheet Repeat(MTQ,1,3)/Repeat(COIL_B)
bus MTQ_COILB[1..4] = sheet Repeat(PANEL,1,4)/Repeat(COIL_B)
bus MTQ_INA[1..3] = sheet Repeat(MTQ,1,3)/Repeat(IN1)
bus MTQ_INB[1..3] = sheet Repeat(MTQ,1,3)/Repeat(IN2)
bus MTQ_ISNS[1..3] = sheet Repeat(MTQ,1,3)/Repeat(ISNS)
bus SUNA[1..4] = sheet Repeat(PANEL,1,4)/Repeat(SUN_A)
bus SUNB[1..4] = sheet Repeat(PANEL,1,4)/Repeat(SUN_B)
bus SUNC[1..4] = sheet Repeat(PANEL,1,4)/Repeat(SUN_C)
bus SUND[1..4] = sheet Repeat(PANEL,1,4)/Repeat(SUN_D)

## Sheet  PWR_IN.SchDoc
size A4; SheetNumber: 3; SheetTotal: 9
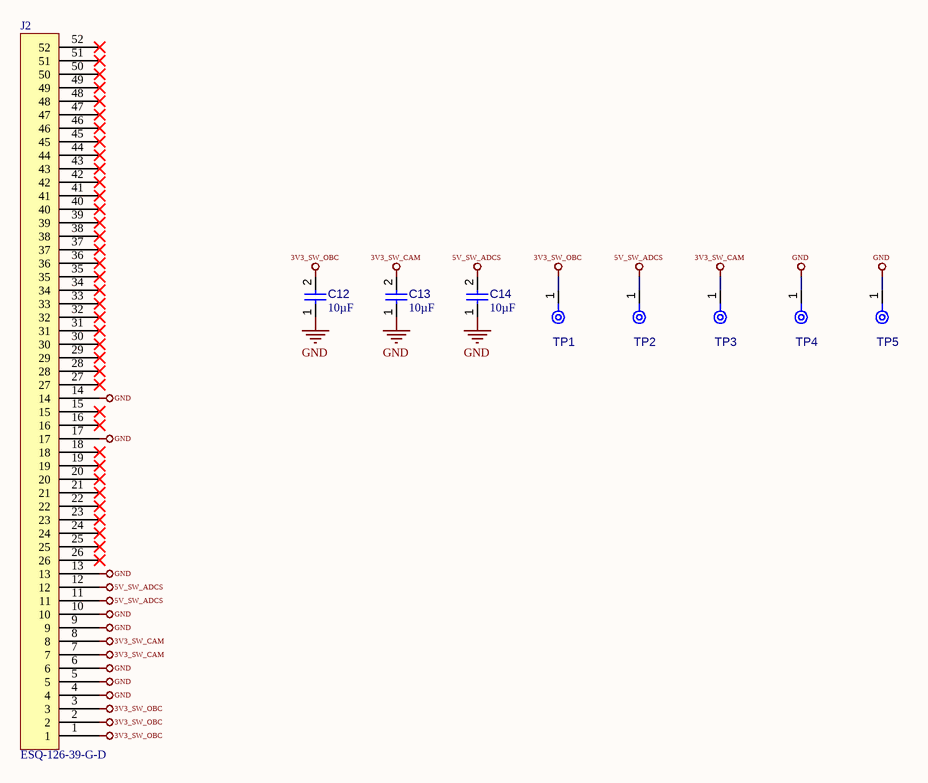
[diagram p2:  PWR_IN.SchDoc]

### Parts
C12  value 10µF  [CAPC0805(2012)145_L]  (hidden comment: Capacitor 10µF +/-20% 25V 0805)
C13  value 10µF  [CAPC0805(2012)145_L]  (hidden comment: Capacitor 10µF +/-20% 25V 0805)
C14  value 10µF  [CAPC0805(2012)145_L]  (hidden comment: Capacitor 10µF +/-20% 25V 0805)
J2  ESQ-126-39-G-D  [CONN_ESQ-126-39-G-D_SAI]
TP1  TPAD6R  [TP06R]  (value not drawn)  (no BOM)
TP2  TPAD6R  [TP06R]  (value not drawn)  (no BOM)
TP3  TPAD6R  [TP06R]  (value not drawn)  (no BOM)
TP4  TPAD6R  [TP06R]  (value not drawn)  (no BOM)
TP5  TPAD6R  [TP06R]  (value not drawn)  (no BOM)

### Nets
3V3_SW_CAM: C13.2 J2.7 J2.8 TP3.1(TP)
3V3_SW_OBC: C12.2 J2.1 J2.2 J2.3 TP1.1(TP)
5V_SW_ADCS: C14.2 J2.11 J2.12 TP2.1(TP)
GND: C12.1 C13.1 C14.1 J2.4 J2.5 J2.6 J2.9 J2.10 J2.13 J2.14 J2.17 TP4.1(TP) TP5.1(TP)

Not connected (* = marked no-connect by the designer): J2 15* 16* 18* 19* 20* 21* 22* 23* 24* 25* 26* 27* 28* 29* 30* 31* 32* 33* 34* 35* 36* 37* 38* 39* 40* 41* 42* 43* 44* 45* 46* 47* 48* 49* 50* 51* 52*

### Library data of the parts
C12-C14 = CMP-001-00079-4: Chip Capacitor, 10µF +/-20%, 25V, 0805, Thickness 1.45 mm; Tolerance: 10%; Max Operating Temperature: 85°C; Case/Package: 0805; Voltage Rating: 25V; Min Operating Temperature: -55°C; Mounting Technology: SMT; Pins: 2
J2 = CMP-002-00077-3: Samtec ESQ Series, 2.54mm Pitch, 52-Pin Double Row Receptacle, Board-to-Board, Right Angle, TH; Manufacturer Lifecycle Status: PRODUCTION; Max Voltage Rating (AC): 550V; Contact Resistance: 10mΩ; Number of Contacts: 52; Max Current Rating: 6.9A; Housing Color: Black; Max Operating Temperature: 125°C; Depth: 4.95mm; Radiation Hardening: No; RoHS: Compliant; Housing Material: Polyester; Pitch: 2.54mm; Number of Rows: 2; Orientation: Straight; Length: 66.55mm; Lifecycle Status: Production; Packaging: Bulk; Contact Plating: Gold; Termination: Solder; Pins: 52; Min Operating Temperature: -55°C; Contact Material: Bronze
TP1-TP5 = CMP-00028-00002-2: 0.6mm round; Pins: 1

## Sheet  MCU_CORE.SchDoc
size A4; SheetNumber: 4; SheetTotal: 9
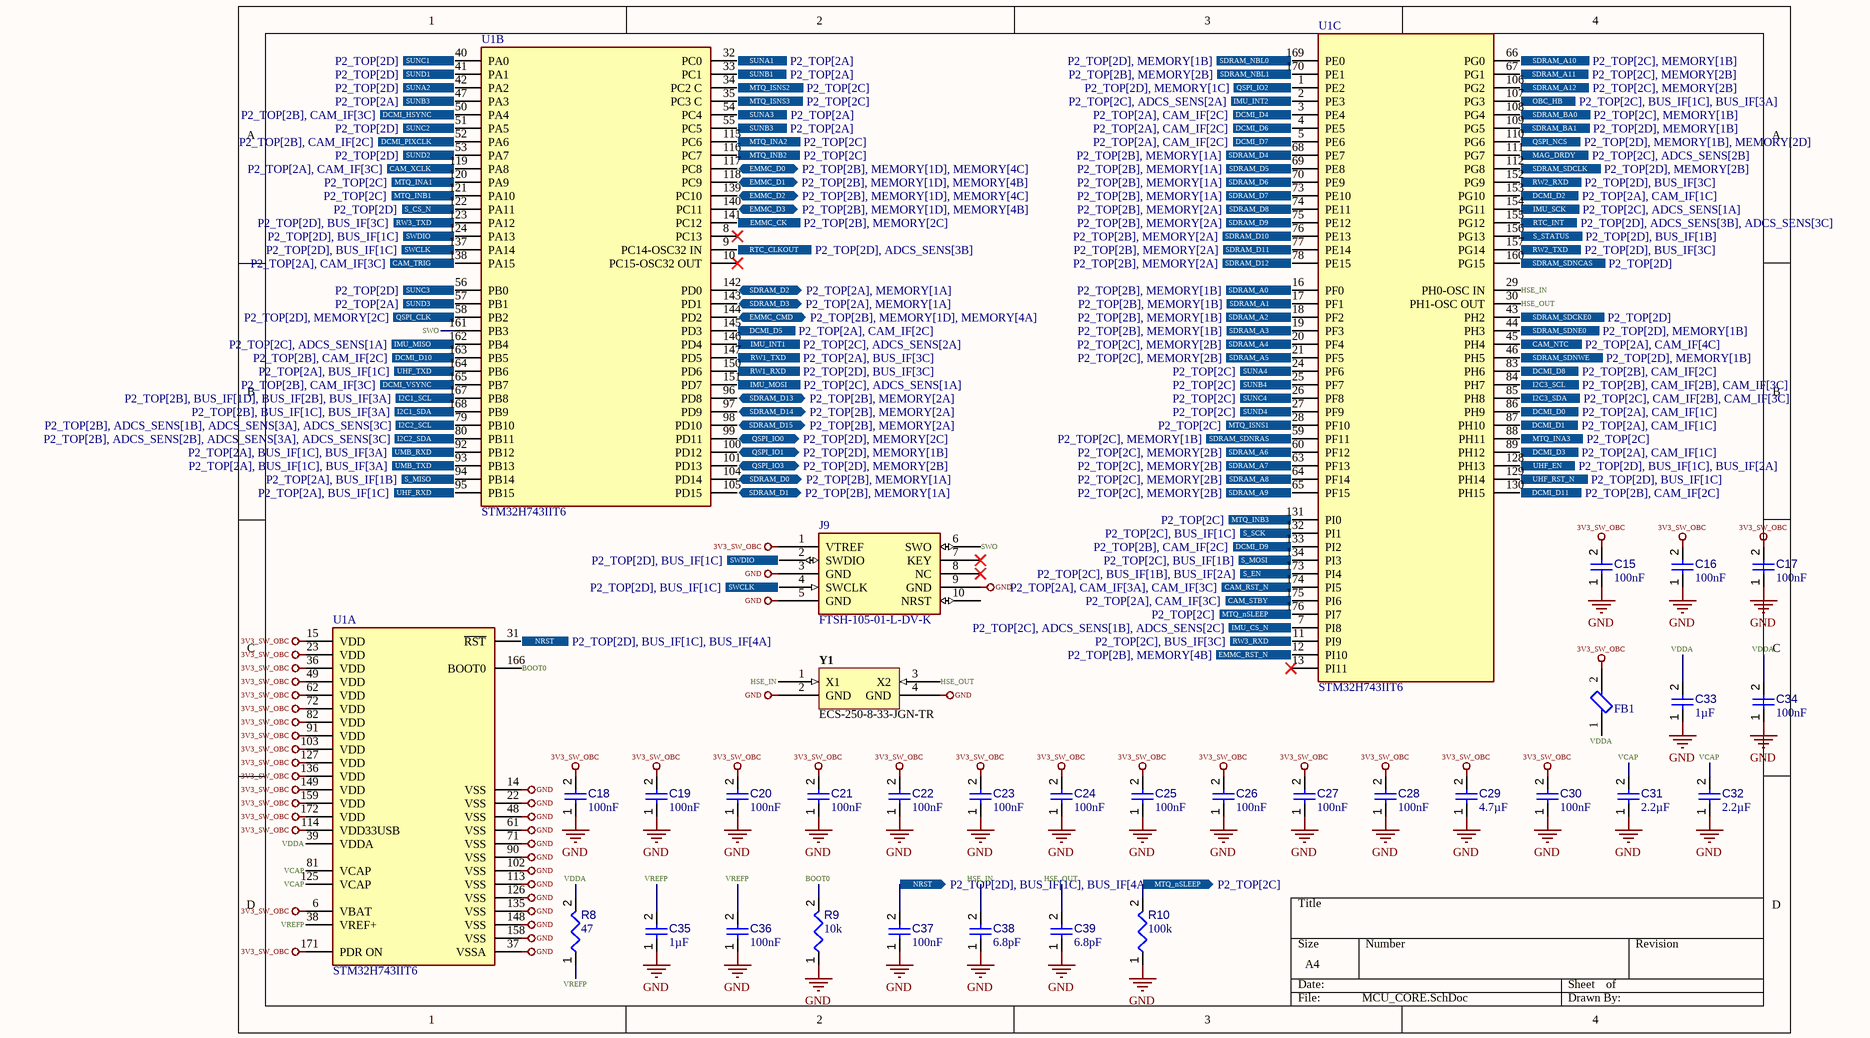
[diagram p3:  MCU_CORE.SchDoc]

### Parts
C15  value 100nF  [CAPC0402(1005)60_L]  (hidden comment: Capacitor 100nF +/-20% 25V 0402)
C16  value 100nF  [CAPC0402(1005)60_L]  (hidden comment: Capacitor 100nF +/-20% 25V 0402)
C17  value 100nF  [CAPC0402(1005)60_L]  (hidden comment: Capacitor 100nF +/-20% 25V 0402)
C18  value 100nF  [CAPC0402(1005)60_L]  (hidden comment: Capacitor 100nF +/-20% 25V 0402)
C19  value 100nF  [CAPC0402(1005)60_L]  (hidden comment: Capacitor 100nF +/-20% 25V 0402)
C20  value 100nF  [CAPC0402(1005)60_L]  (hidden comment: Capacitor 100nF +/-20% 25V 0402)
C21  value 100nF  [CAPC0402(1005)60_L]  (hidden comment: Capacitor 100nF +/-20% 25V 0402)
C22  value 100nF  [CAPC0402(1005)60_L]  (hidden comment: Capacitor 100nF +/-20% 25V 0402)
C23  value 100nF  [CAPC0402(1005)60_L]  (hidden comment: Capacitor 100nF +/-20% 25V 0402)
C24  value 100nF  [CAPC0402(1005)60_L]  (hidden comment: Capacitor 100nF +/-20% 25V 0402)
C25  value 100nF  [CAPC0402(1005)60_L]  (hidden comment: Capacitor 100nF +/-20% 25V 0402)
C26  value 100nF  [CAPC0402(1005)60_L]  (hidden comment: Capacitor 100nF +/-20% 25V 0402)
C27  value 100nF  [CAPC0402(1005)60_L]  (hidden comment: Capacitor 100nF +/-20% 25V 0402)
C28  value 100nF  [CAPC0402(1005)60_L]  (hidden comment: Capacitor 100nF +/-20% 25V 0402)
C29  value 4.7µF  [CAPC0805(2012)145_L]  (hidden comment: Capacitor 4.7µF +/-40% 25V 0805)
C30  value 100nF  [CAPC0402(1005)60_L]  (hidden comment: Capacitor 100nF +/-20% 10V 0402)
C31  value 2.2µF  [CAPC0603(1608)100_L]  (hidden comment: Capacitor 4.7µF +/-20% 10V 0603)
C32  value 2.2µF  [CAPC0603(1608)100_L]  (hidden comment: Capacitor 4.7µF +/-20% 10V 0603)
C33  value 1µF  [CAPC0603(1608)100_L]  (hidden comment: Capacitor 1µF +/-0.1% 25V 0603)
C34  value 100nF  [CAPC0402(1005)60_L]  (hidden comment: Capacitor 100nF +/-20% 10V 0402)
C35  value 1µF  [CAPC0603(1608)100_L]  (hidden comment: Capacitor 1µF +/-0.1% 25V 0603)
C36  value 100nF  [CAPC0402(1005)60_L]  (hidden comment: Capacitor 100nF +/-20% 10V 0402)
C37  value 100nF  [CAPC0402(1005)60_L]  (hidden comment: Capacitor 100nF +/-20% 10V 0402)
C38  value 6.8pF  [CAPC1005X56X25NL10T15]  (hidden comment: Capacitor 6.8 nF +/- 10% 16 V 0402)
C39  value 6.8pF  [CAPC1005X56X25NL10T15]  (hidden comment: Capacitor 6.8 nF +/- 10% 16 V 0402)
FB1  BLM15AG601SN1D  [FP-BLM15-0_05-IPC_A]  (value not drawn)
J9  FTSH-105-01-L-DV-K  [SMTC-FTSH-105-01-L-DV-K_V]
R8  value 47  [RESC0402(1005)_L]  (hidden comment: Resistor 47K5 +/-1 % 0402 63 mW)
R9  value 10k  [RESC1005X40X25ML05T05]  (hidden comment: Resistor 10k +/-1% 0402 100 mW)
R10  value 100k  [RESC1005X40X25ML05T05]  (hidden comment: Resistor 100k +/-1% 0402 100 mW)
U1  STM32H743IIT6  [FP-LQFP176-1T-IPC_B]  (parts A,B,C of 3)
Y1  ECS-250-8-33-JGN-TR  [ECS-250-8-33-JGN-TR-Footprint-1]

### Ports
CAM_NTC (out, see P2_TOP[2A], CAM_IF[4C]), CAM_RST_N (out, see P2_TOP[2A], CAM_IF[3A], CAM_IF[3C]), CAM_STBY (out, see P2_TOP[2A], CAM_IF[3C]), CAM_TRIG (out, see P2_TOP[2A], CAM_IF[3C]), CAM_XCLK (out, see P2_TOP[2A], CAM_IF[3C]), DCMI_D0 (out, see P2_TOP[2A], CAM_IF[1C]), DCMI_D1 (out, see P2_TOP[2A], CAM_IF[1C]), DCMI_D2 (out, see P2_TOP[2A], CAM_IF[1C]), DCMI_D3 (out, see P2_TOP[2A], CAM_IF[1C]), DCMI_D4 (out, see P2_TOP[2A], CAM_IF[2C]), DCMI_D5 (out, see P2_TOP[2A], CAM_IF[2C]), DCMI_D6 (out, see P2_TOP[2A], CAM_IF[2C]), DCMI_D7 (out, see P2_TOP[2A], CAM_IF[2C]), DCMI_D8 (out, see P2_TOP[2B], CAM_IF[2C]), DCMI_D9 (out, see P2_TOP[2B], CAM_IF[2C]), DCMI_D10 (out, see P2_TOP[2B], CAM_IF[2C]), DCMI_D11 (out, see P2_TOP[2B], CAM_IF[2C]), DCMI_HSYNC (out, see P2_TOP[2B], CAM_IF[3C]), DCMI_PIXCLK (out, see P2_TOP[2B], CAM_IF[2C]), DCMI_VSYNC (out, see P2_TOP[2B], CAM_IF[3C]), EMMC_CK (out, see P2_TOP[2B], MEMORY[2C]), EMMC_CMD (bidir, see P2_TOP[2B], MEMORY[1D], MEMORY[4A]), EMMC_D0 (bidir, see P2_TOP[2B], MEMORY[1D], MEMORY[4C]), EMMC_D1 (bidir, see P2_TOP[2B], MEMORY[1D], MEMORY[4B]), EMMC_D2 (bidir, see P2_TOP[2B], MEMORY[1D], MEMORY[4C]), EMMC_D3 (bidir, see P2_TOP[2B], MEMORY[1D], MEMORY[4B]), EMMC_RST_N (out, see P2_TOP[2B], MEMORY[4B]), I2C1_SCL (out, see P2_TOP[2B], BUS_IF[1D], BUS_IF[2B], BUS_IF[3A]), I2C1_SDA (out, see P2_TOP[2B], BUS_IF[1C], BUS_IF[3A]), I2C2_SCL (out, see P2_TOP[2B], ADCS_SENS[1B], ADCS_SENS[3A], ADCS_SENS[3C]), I2C2_SDA (out, see P2_TOP[2B], ADCS_SENS[2B], ADCS_SENS[3A], ADCS_SENS[3C]), I2C3_SCL (out, see P2_TOP[2B], CAM_IF[2B], CAM_IF[3C]), I2C3_SDA (out, see P2_TOP[2C], CAM_IF[2B], CAM_IF[3C]), IMU_CS_N (out, see P2_TOP[2C], ADCS_SENS[1B], ADCS_SENS[2C]), IMU_INT1 (out, see P2_TOP[2C], ADCS_SENS[2A]), IMU_INT2 (out, see P2_TOP[2C], ADCS_SENS[2A]), IMU_MISO (out, see P2_TOP[2C], ADCS_SENS[1A]), IMU_MOSI (out, see P2_TOP[2C], ADCS_SENS[1A]), IMU_SCK (out, see P2_TOP[2C], ADCS_SENS[1A]), MAG_DRDY (out, see P2_TOP[2C], ADCS_SENS[2B]), MTQ_INA1 (out, see P2_TOP[2C]), MTQ_INA2 (out, see P2_TOP[2C]), MTQ_INA3 (out, see P2_TOP[2C]), MTQ_INB1 (out, see P2_TOP[2C]), MTQ_INB2 (out, see P2_TOP[2C]), MTQ_INB3 (out, see P2_TOP[2C]), MTQ_ISNS1 (out, see P2_TOP[2C]), MTQ_ISNS2 (out, see P2_TOP[2C]), MTQ_ISNS3 (out, see P2_TOP[2C]), MTQ_nSLEEP (out, see P2_TOP[2C]), NRST (out, see P2_TOP[2D], BUS_IF[1C], BUS_IF[4A]), OBC_HB (out, see P2_TOP[2C], BUS_IF[1C], BUS_IF[3A]), QSPI_CLK (out, see P2_TOP[2D], MEMORY[2C]), QSPI_IO0 (bidir, see P2_TOP[2D], MEMORY[2C]), QSPI_IO1 (bidir, see P2_TOP[2D], MEMORY[1B]), QSPI_IO2 (out, see P2_TOP[2D], MEMORY[1C]), QSPI_IO3 (bidir, see P2_TOP[2D], MEMORY[2B]), QSPI_NCS (out, see P2_TOP[2D], MEMORY[1B], MEMORY[2D]), RTC_CLKOUT (out, see P2_TOP[2D], ADCS_SENS[3B]), RTC_INT (out, see P2_TOP[2D], ADCS_SENS[3B], ADCS_SENS[3C]), RW1_RXD (out, see P2_TOP[2D], BUS_IF[3C]), RW1_TXD (out, see P2_TOP[2A], BUS_IF[3C]), RW2_RXD (out, see P2_TOP[2D], BUS_IF[3C]), RW2_TXD (out, see P2_TOP[2D], BUS_IF[3C]), RW3_RXD (out, see P2_TOP[2C], BUS_IF[3C]), RW3_TXD (out, see P2_TOP[2D], BUS_IF[3C]), S_CS_N (out, see P2_TOP[2D]), S_EN (out, see P2_TOP[2C], BUS_IF[1B], BUS_IF[2A]), S_MISO (out, see P2_TOP[2A], BUS_IF[1B]), S_MOSI (out, see P2_TOP[2C], BUS_IF[1B]), S_SCK (out, see P2_TOP[2C], BUS_IF[1C]), S_STATUS (out, see P2_TOP[2D], BUS_IF[1B]), SDRAM_A0 (out, see P2_TOP[2B], MEMORY[1B]), SDRAM_A1 (out, see P2_TOP[2B], MEMORY[1B]), SDRAM_A2 (out, see P2_TOP[2B], MEMORY[1B]), SDRAM_A3 (out, see P2_TOP[2B], MEMORY[1B]), SDRAM_A4 (out, see P2_TOP[2C], MEMORY[2B]), SDRAM_A5 (out, see P2_TOP[2C], MEMORY[2B]), SDRAM_A6 (out, see P2_TOP[2C], MEMORY[2B]), SDRAM_A7 (out, see P2_TOP[2C], MEMORY[2B]), SDRAM_A8 (out, see P2_TOP[2C], MEMORY[2B]), SDRAM_A9 (out, see P2_TOP[2C], MEMORY[2B]), SDRAM_A10 (out, see P2_TOP[2C], MEMORY[1B]), SDRAM_A11 (out, see P2_TOP[2C], MEMORY[2B]), SDRAM_A12 (out, see P2_TOP[2C], MEMORY[2B]), SDRAM_BA0 (out, see P2_TOP[2C], MEMORY[1B]), SDRAM_BA1 (out, see P2_TOP[2D], MEMORY[1B]), SDRAM_D0 (bidir, see P2_TOP[2B], MEMORY[1A]), SDRAM_D1 (bidir, see P2_TOP[2B], MEMORY[1A]), SDRAM_D2 (bidir, see P2_TOP[2A], MEMORY[1A]), SDRAM_D3 (bidir, see P2_TOP[2A], MEMORY[1A]), SDRAM_D4 (out, see P2_TOP[2B], MEMORY[1A]), SDRAM_D5 (out, see P2_TOP[2B], MEMORY[1A]), SDRAM_D6 (out, see P2_TOP[2B], MEMORY[1A]), SDRAM_D7 (out, see P2_TOP[2B], MEMORY[1A]), SDRAM_D8 (out, see P2_TOP[2B], MEMORY[2A]), SDRAM_D9 (out, see P2_TOP[2B], MEMORY[2A]), SDRAM_D10 (out, see P2_TOP[2B], MEMORY[2A]), SDRAM_D11 (out, see P2_TOP[2B], MEMORY[2A]), SDRAM_D12 (out, see P2_TOP[2B], MEMORY[2A]), SDRAM_D13 (bidir, see P2_TOP[2B], MEMORY[2A]), SDRAM_D14 (bidir, see P2_TOP[2B], MEMORY[2A]), SDRAM_D15 (bidir, see P2_TOP[2B], MEMORY[2A]), SDRAM_NBL0 (out, see P2_TOP[2D], MEMORY[1B]), SDRAM_NBL1 (out, see P2_TOP[2B], MEMORY[2B]), SDRAM_SDCKE0 (out, see P2_TOP[2D]), SDRAM_SDCLK (out, see P2_TOP[2D], MEMORY[2B]), SDRAM_SDNCAS (out, see P2_TOP[2D]), SDRAM_SDNE0 (out, see P2_TOP[2D], MEMORY[1B]), SDRAM_SDNRAS (out, see P2_TOP[2C], MEMORY[1B]), SDRAM_SDNWE (out, see P2_TOP[2D], MEMORY[1B]), SUNA1 (out, see P2_TOP[2A]), SUNA2 (out, see P2_TOP[2D]), SUNA3 (out, see P2_TOP[2A]), SUNA4 (out, see P2_TOP[2C]), SUNB1 (out, see P2_TOP[2A]), SUNB3 (out, see P2_TOP[2A]), SUNB4 (out, see P2_TOP[2C]), SUNC1 (out, see P2_TOP[2D]), SUNC2 (out, see P2_TOP[2D]), SUNC3 (out, see P2_TOP[2D]), SUNC4 (out, see P2_TOP[2C]), SUND1 (out, see P2_TOP[2D]), SUND2 (out, see P2_TOP[2D]), SUND3 (out, see P2_TOP[2A]), SUND4 (out, see P2_TOP[2C]), SWCLK (out, see P2_TOP[2D], BUS_IF[1C]), SWDIO (out, see P2_TOP[2D], BUS_IF[1C]), UHF_EN (out, see P2_TOP[2D], BUS_IF[1C], BUS_IF[2A]), UHF_RST_N (out, see P2_TOP[2D], BUS_IF[1C]), UHF_RXD (out, see P2_TOP[2A], BUS_IF[1C]), UHF_TXD (out, see P2_TOP[2A], BUS_IF[1C]), UMB_RXD (out, see P2_TOP[2A], BUS_IF[1C], BUS_IF[3A]), UMB_TXD (out, see P2_TOP[2A], BUS_IF[1C], BUS_IF[3A])

### Nets
3V3_SW_OBC: C15.2 C16.2 C17.2 C18.2 C19.2 C20.2 C21.2 C22.2 C23.2 C24.2 C25.2 C26.2 C27.2 C28.2 C29.2 C30.2 FB1.2 J9.1(VTREF) U1.6(VBAT) U1.15(VDD) U1.23(VDD) U1.36(VDD) U1.49(VDD) U1.62(VDD) U1.72(VDD) U1.82(VDD) U1.91(VDD) U1.103(VDD) U1.114(VDD33USB) U1.127(VDD) U1.136(VDD) U1.149(VDD) U1.159(VDD) U1.171(PDR_ON) U1.172(VDD)
GND: C15.1 C16.1 C17.1 C18.1 C19.1 C20.1 C21.1 C22.1 C23.1 C24.1 C25.1 C26.1 C27.1 C28.1 C29.1 C30.1 C31.1 C32.1 C33.1 C34.1 C35.1 C36.1 C37.1 C38.1 C39.1 J9.3(GND) J9.5(GND) J9.9(GND) R9.1 R10.1 U1.14(VSS) U1.22(VSS) U1.37(VSSA) U1.48(VSS) U1.61(VSS) U1.71(VSS) U1.90(VSS) U1.102(VSS) U1.113(VSS) U1.126(VSS) U1.135(VSS) U1.148(VSS) U1.158(VSS) Y1.2(GND) Y1.4(GND)
BOOT0: R9.2 U1.166(BOOT0)
HSE_IN: C38.2 U1.29(PH0-OSC_IN) Y1.1(X1)
HSE_OUT: C39.2 U1.30(PH1-OSC_OUT) Y1.3(X2)
SWO: J9.6(SWO) U1.161(PB3)
VCAP: C31.2 C32.2 U1.81(VCAP) U1.125(VCAP)
VDDA: C33.2 C34.2 FB1.1 R8.2 U1.39(VDDA)
VREFP: C35.2 C36.2 R8.1 U1.38(VREF+)
NetC37_2: C37.2 U1.31(~{RST}) ; port NRST
NetJ9_2: J9.2(SWDIO) U1.124(PA13) ; port SWDIO
NetJ9_4: J9.4(SWCLK) U1.137(PA14) ; port SWCLK
NetR10_2: R10.2 U1.176(PI7) ; port MTQ_nSLEEP
NetU1_1: U1.1(PE2) ; port QSPI_IO2
NetU1_2: U1.2(PE3) ; port IMU_INT2
NetU1_3: U1.3(PE4) ; port DCMI_D4
NetU1_4: U1.4(PE5) ; port DCMI_D6
NetU1_5: U1.5(PE6) ; port DCMI_D7
NetU1_7: U1.7(PI8) ; port IMU_CS_N
NetU1_9: U1.9(PC14-OSC32_IN) ; port RTC_CLKOUT
NetU1_11: U1.11(PI9) ; port RW3_RXD
NetU1_12: U1.12(PI10) ; port EMMC_RST_N
NetU1_16: U1.16(PF0) ; port SDRAM_A0
NetU1_17: U1.17(PF1) ; port SDRAM_A1
NetU1_18: U1.18(PF2) ; port SDRAM_A2
NetU1_19: U1.19(PF3) ; port SDRAM_A3
NetU1_20: U1.20(PF4) ; port SDRAM_A4
NetU1_21: U1.21(PF5) ; port SDRAM_A5
NetU1_24: U1.24(PF6) ; port SUNA4
NetU1_25: U1.25(PF7) ; port SUNB4
NetU1_26: U1.26(PF8) ; port SUNC4
NetU1_27: U1.27(PF9) ; port SUND4
NetU1_28: U1.28(PF10) ; port MTQ_ISNS1
NetU1_32: U1.32(PC0) ; port SUNA1
NetU1_33: U1.33(PC1) ; port SUNB1
NetU1_34: U1.34(PC2_C) ; port MTQ_ISNS2
NetU1_35: U1.35(PC3_C) ; port MTQ_ISNS3
NetU1_40: U1.40(PA0) ; port SUNC1
NetU1_41: U1.41(PA1) ; port SUND1
NetU1_42: U1.42(PA2) ; port SUNA2
NetU1_43: U1.43(PH2) ; port SDRAM_SDCKE0
NetU1_44: U1.44(PH3) ; port SDRAM_SDNE0
NetU1_45: U1.45(PH4) ; port CAM_NTC
NetU1_46: U1.46(PH5) ; port SDRAM_SDNWE
NetU1_47: U1.47(PA3) U1.55(PC5) ; port SUNB3
NetU1_50: U1.50(PA4) ; port DCMI_HSYNC
NetU1_51: U1.51(PA5) ; port SUNC2
NetU1_52: U1.52(PA6) ; port DCMI_PIXCLK
NetU1_53: U1.53(PA7) ; port SUND2
NetU1_54: U1.54(PC4) ; port SUNA3
NetU1_56: U1.56(PB0) ; port SUNC3
NetU1_57: U1.57(PB1) ; port SUND3
NetU1_58: U1.58(PB2) ; port QSPI_CLK
NetU1_59: U1.59(PF11) ; port SDRAM_SDNRAS
NetU1_60: U1.60(PF12) ; port SDRAM_A6
NetU1_63: U1.63(PF13) ; port SDRAM_A7
NetU1_64: U1.64(PF14) ; port SDRAM_A8
NetU1_65: U1.65(PF15) ; port SDRAM_A9
NetU1_66: U1.66(PG0) ; port SDRAM_A10
NetU1_67: U1.67(PG1) ; port SDRAM_A11
NetU1_68: U1.68(PE7) ; port SDRAM_D4
NetU1_69: U1.69(PE8) ; port SDRAM_D5
NetU1_70: U1.70(PE9) ; port SDRAM_D6
NetU1_73: U1.73(PE10) ; port SDRAM_D7
NetU1_74: U1.74(PE11) ; port SDRAM_D8
NetU1_75: U1.75(PE12) ; port SDRAM_D9
NetU1_76: U1.76(PE13) ; port SDRAM_D10
NetU1_77: U1.77(PE14) ; port SDRAM_D11
NetU1_78: U1.78(PE15) ; port SDRAM_D12
NetU1_79: U1.79(PB10) ; port I2C2_SCL
NetU1_80: U1.80(PB11) ; port I2C2_SDA
NetU1_83: U1.83(PH6) ; port DCMI_D8
NetU1_84: U1.84(PH7) ; port I2C3_SCL
NetU1_85: U1.85(PH8) ; port I2C3_SDA
NetU1_86: U1.86(PH9) ; port DCMI_D0
NetU1_87: U1.87(PH10) ; port DCMI_D1
NetU1_88: U1.88(PH11) ; port MTQ_INA3
NetU1_89: U1.89(PH12) ; port DCMI_D3
NetU1_92: U1.92(PB12) ; port UMB_RXD
NetU1_93: U1.93(PB13) ; port UMB_TXD
NetU1_94: U1.94(PB14) ; port S_MISO
NetU1_95: U1.95(PB15) ; port UHF_RXD
NetU1_96: U1.96(PD8) ; port SDRAM_D13
NetU1_97: U1.97(PD9) ; port SDRAM_D14
NetU1_98: U1.98(PD10) ; port SDRAM_D15
NetU1_99: U1.99(PD11) ; port QSPI_IO0
NetU1_100: U1.100(PD12) ; port QSPI_IO1
NetU1_101: U1.101(PD13) ; port QSPI_IO3
NetU1_104: U1.104(PD14) ; port SDRAM_D0
NetU1_105: U1.105(PD15) ; port SDRAM_D1
NetU1_106: U1.106(PG2) ; port SDRAM_A12
NetU1_107: U1.107(PG3) ; port OBC_HB
NetU1_108: U1.108(PG4) ; port SDRAM_BA0
NetU1_109: U1.109(PG5) ; port SDRAM_BA1
NetU1_110: U1.110(PG6) ; port QSPI_NCS
NetU1_111: U1.111(PG7) ; port MAG_DRDY
NetU1_112: U1.112(PG8) ; port SDRAM_SDCLK
NetU1_115: U1.115(PC6) ; port MTQ_INA2
NetU1_116: U1.116(PC7) ; port MTQ_INB2
NetU1_117: U1.117(PC8) ; port EMMC_D0
NetU1_118: U1.118(PC9) ; port EMMC_D1
NetU1_119: U1.119(PA8) ; port CAM_XCLK
NetU1_120: U1.120(PA9) ; port MTQ_INA1
NetU1_121: U1.121(PA10) ; port MTQ_INB1
NetU1_122: U1.122(PA11) ; port S_CS_N
NetU1_123: U1.123(PA12) ; port RW3_TXD
NetU1_128: U1.128(PH13) ; port UHF_EN
NetU1_129: U1.129(PH14) ; port UHF_RST_N
NetU1_130: U1.130(PH15) ; port DCMI_D11
NetU1_131: U1.131(PI0) ; port MTQ_INB3
NetU1_132: U1.132(PI1) ; port S_SCK
NetU1_133: U1.133(PI2) ; port DCMI_D9
NetU1_134: U1.134(PI3) ; port S_MOSI
NetU1_138: U1.138(PA15) ; port CAM_TRIG
NetU1_139: U1.139(PC10) ; port EMMC_D2
NetU1_140: U1.140(PC11) ; port EMMC_D3
NetU1_141: U1.141(PC12) ; port EMMC_CK
NetU1_142: U1.142(PD0) ; port SDRAM_D2
NetU1_143: U1.143(PD1) ; port SDRAM_D3
NetU1_144: U1.144(PD2) ; port EMMC_CMD
NetU1_145: U1.145(PD3) ; port DCMI_D5
NetU1_146: U1.146(PD4) ; port IMU_INT1
NetU1_147: U1.147(PD5) ; port RW1_TXD
NetU1_150: U1.150(PD6) ; port RW1_RXD
NetU1_151: U1.151(PD7) ; port IMU_MOSI
NetU1_152: U1.152(PG9) ; port RW2_RXD
NetU1_153: U1.153(PG10) ; port DCMI_D2
NetU1_154: U1.154(PG11) ; port IMU_SCK
NetU1_155: U1.155(PG12) ; port RTC_INT
NetU1_156: U1.156(PG13) ; port S_STATUS
NetU1_157: U1.157(PG14) ; port RW2_TXD
NetU1_160: U1.160(PG15) ; port SDRAM_SDNCAS
NetU1_162: U1.162(PB4) ; port IMU_MISO
NetU1_163: U1.163(PB5) ; port DCMI_D10
NetU1_164: U1.164(PB6) ; port UHF_TXD
NetU1_165: U1.165(PB7) ; port DCMI_VSYNC
NetU1_167: U1.167(PB8) ; port I2C1_SCL
NetU1_168: U1.168(PB9) ; port I2C1_SDA
NetU1_169: U1.169(PE0) ; port SDRAM_NBL0
NetU1_170: U1.170(PE1) ; port SDRAM_NBL1
NetU1_173: U1.173(PI4) ; port S_EN
NetU1_174: U1.174(PI5) ; port CAM_RST_N
NetU1_175: U1.175(PI6) ; port CAM_STBY

Not connected (* = marked no-connect by the designer): J9 7(KEY)* 8(NC)* 10(NRST); U1 8(PC13)* 10(PC15-OSC32_OUT)* 13(PI11)*

### Library data of the parts
C15-C28 = CMP-001-00065-4: as C1 on sheet  MEMORY; Max Operating Temperature: 85°C; Min Operating Temperature: -55°C; Pins: 2; Voltage Rating: 25V; Mounting Technology: SMT; Case/Package: 0402
C29 = CMP-001-00080-4: Chip Capacitor, 4.7µF +/-40%, 25V, 0805, Thickness 1.45 mm; Tolerance: 20%; Voltage Rating: 25V; Min Operating Temperature: -55°C; Max Operating Temperature: 85°C; Pins: 2; Mounting Technology: SMT; Case/Package: 0805
C30 C34 C36 C37 = CMP-001-00061-3: Chip Capacitor, 100nF +/-20%, 10V, 0402, Thickness 0.6 mm; Tolerance: 20%; Mounting Technology: SMT; Voltage Rating: 10V; Max Operating Temperature: 85°C; Pins: 2; Case/Package: 0402; Min Operating Temperature: -55°C
C31 C32 = CMP-001-00076-4: Chip Capacitor, 4.7µF +/-20%, 10V, 0603, Thickness 1 mm; Tolerance: 10%; Mounting Technology: SMT; Case/Package: 0603; Pins: 2; Min Operating Temperature: -55°C; Max Operating Temperature: 85°C; Voltage Rating: 10V
C33 C35 = CMP-001-00055-4: Chip Capacitor, 1µF +/-0.1%, 25V, 0603, Thickness 1 mm; Tolerance: 20%; Min Operating Temperature: -55°C; Max Operating Temperature: 85°C; Voltage Rating: 25V; Mounting Technology: SMT; Case/Package: 0603; Pins: 2
C38 C39 = CMP-001-00000-6: Chip Capacitor, 6.8 nF, +/- 10%, 16 V, 0402 (1005 Metric); Capacitor Type: Ceramic; Voltage Rating: 16V; RoHS Compliant: True; Pins: 2; Case/Package: 0402; Min Operating Temperature: -55°C; Tolerance: 10%; Mounting Technology: SM; Max Operating Temperature: 125°C
FB1 = CMP-00030-00001-1: Ferrite Beads Multi-Layer 600Ohm 25% 100MHz 300mA 520mOhm DCR 0402 Paper T/R; Material: Ferrite, Steel; Number of Circuits: 1; DC Resistance (DCR): 520mΩ; Impedance: 600Ω; Shielding: Unshielded; Country of Origin: Japan; Lead Free: Lead Free; Introduction Date: 2002-09-05; Test Frequency: 100MHz; Radiation Hardening: No; REACH SVHC: Unaffected; Lifecycle Status: Production; RMS Current (Irms): 300mA; Depth: 550µm; Number of Terminals: 2; Height: 500µm; Max DC Current: 300mA; Min Operating Temperature: -55°C; Core Material: Ferrite; Packaging: Tape and Reel; RoHS: Compliant; Length: 1mm; Case Code (Imperial): 0402; Frequency: 100MHz; ESR: 520mΩ; Clock Frequency: 100MHz; Number of Lines: 1; DC Current: 300mA; Case/Package: 0402; Max Current Rating: 300mA; Max Operating Temperature: 125°C; Schedule B: 8504500000, 8504500000; Current Rating: 300mA; Termination: SMD/SMT; Military Standard: Not; Tolerance: 25%; Export Control Classification Number (ECCN) Code: EAR99; Harmonized Tariff Schedule (HTS) Code: 8504.50.80.00; Case Code (Metric): 1005; Mounting Technology: Surface Mount; Pins: 2; Width: 500µm
J9 = CMP-002-00079-2: Conn Shrouded Header (2 Sides) HDR 10 POS 1.27mm Solder ST Top Entry SMD TIGER CLAW™ Tube; Manufacturer Lifecycle Status: PRODUCTION; Max Current Rating: 1.75A; Number of Contacts: 10; Connector Type: Male Pin; Gender: Female; Housing Color: Black; Color: Black; REACH SVHC: Unaffected; Termination: Solder; Pitch: 1.27mm; Row Spacing: 1.27mm; Contact Plating: Gold; Radiation Hardening: No; Length: 6.35mm; Depth: 3.43mm; Contact Mating Length: 3.048mm; Lifecycle Status: Production; Pins: 10; Mounting Technology: Surface Mount; Lead Free: Lead Free; Contact Material: Bronze; Number of Rows: 2; Min Operating Temperature: -55°C; Number of Positions: 10; Max Operating Temperature: 125°C; Housing Material: Polymer; RoHS: Compliant
R8 = CMP-009-00137-3: Chip Resistor, 47,5 kOhms, +/-1 %, 63 mW, -55 to 155 degC, 0402; Power: 63mW; Tolerance: 1%; Pins: 2; Case/Package: 0402; Min Operating Temperature: -55°C; Max Operating Temperature: 155°C
R9 = CMP-009-00015-5: as R2 on sheet  MEMORY; Case/Package: 0402; RoHS Compliant: True; Min Operating Temperature: -55°C; Mounting Technology: SM; Tolerance: 1%; Max Operating Temperature: 155°C; Pins: 2
R10 = CMP-009-00022-5: Chip Resistor, 100 KOhm, +/- 1%, 0.1 W, -55 to 155 degC, 0402 (1005 Metric); Power: 100mW; Voltage Rating: 50V; Mounting Technology: SM; Pins: 2; Min Operating Temperature: -55°C; Tolerance: 1%; RoHS Compliant: True; Case/Package: 0402; Max Operating Temperature: 155°C
U1 = CMP-020-00026-1: MCU 32-Bit STM32 ARM Cortex M7 RISC 2MB Flash 1.8V/2.5V/3.3V 176-Pin LQFP Tray; Max Supply Current: 100mA; Clock Frequency: 480MHz; Number of I/Os: 11; Number of I2C Channels: 4; Number of USB Channels: 2; Number of A/D Converters: 3; RAM Size: 1MB; Frequency: 400MHz; Number of ADC Channels: 36; Peripherals: POR, RTC; Nominal Supply Voltage (DC): 3.3V; Number of Channels: 32; Max Supply Voltage: 3.6V; Number of Timers/Counters: 21; Nominal Supply Current: 4µA; ADC Channels (Resolution): 32-Ch 16-Bit; Min Supply Voltage: 1.62V; Data Bus Width: 32b; Interface: CAN, Ethernet, I2C, IrDA, LIN, SMBus, SPI, UART, USART, USB; Number of SPI Channels: 6; Number of Ethernet Channels: 1; DAC Channels (Resolution): 2-Ch 12-Bit; Max Junction Temperature (Tj): 125°C; Length: 24mm; Terminal Pitch: 500µm; Number of Terminals: 176; Introduction Date: 2016-10-19; Country of Origin: Mainland China; Export Control Classification Number (ECCN) Code: 3A991.A.2; China RoHS: Compliant; Lifecycle Status: Production; Min Operating Temperature: -40°C; Width: 24mm; Max Operating Temperature: 85°C; Number of PWM Channels: 2; Flash Memory Size: 2MB; REACH SVHC: Unaffected; Number of USART Channels: 4; Memory Format: FLASH; Memory Size: 2MB; Height: 1.6mm; Case/Package: LFQFP; Height - Seated (Max): 1.6mm; Temperature Grade: Industrial; Harmonized Tariff Schedule (HTS) Code: 8542.31.00.25; Number of D/A Converters: 2; Ambient Temperature Range High: 85°C; Number of UART Channels: 4; Schedule B: 8542310000; RoHS: Compliant
Y1 = CMP-003-00030-2: Crystal 25MHz ±20ppm (Tol) ±30ppm (Stability) 8pF FUND 40Ohm 4-Pin Mini-CSMD T/R; Frequency Tolerance: 0.002%; ESR: 40; Lifecycle Status: Production; Frequency: 25MHz; Export Control Classification Number (ECCN) Code: EAR99; Mounting Technology: Surface Mount; Max Operating Temperature: 85°C; Introduction Date: 2017-12-19; Load Capacitance: 8pF; Width: 2.5mm; Frequency Stability: 30ppm; RoHS: Compliant; Country of Origin: South Korea, Taiwan; Height - Seated (Max): 800µm; Min Operating Temperature: -40°C; Schedule B: 8541600060, 8541600060; REACH SVHC: Unaffected; Length: 3.2mm